# Altium schematic sheet Blokine diagrama.SchDoc
size A4; Date: *******; ApprovedBy: *******; CheckedBy: None; Author: *******; CompanyName: *******; DrawnBy: Name; Engineer: *******; Organization: *******; Address1: *******; Address2: *******; Address3: *******; Address4: *******; DocumentNumber: Doc Num; Revision: *******; SheetNumber: 1; SheetTotal: 8; CurrentTime: *******; CurrentDate: *******; Time: *******; DocumentFullPathAndName: *******; DocumentName: *******; ModifiedDate: *******; ImagePath: *******; ProjectName: *******; Application_BuildNumber: *******
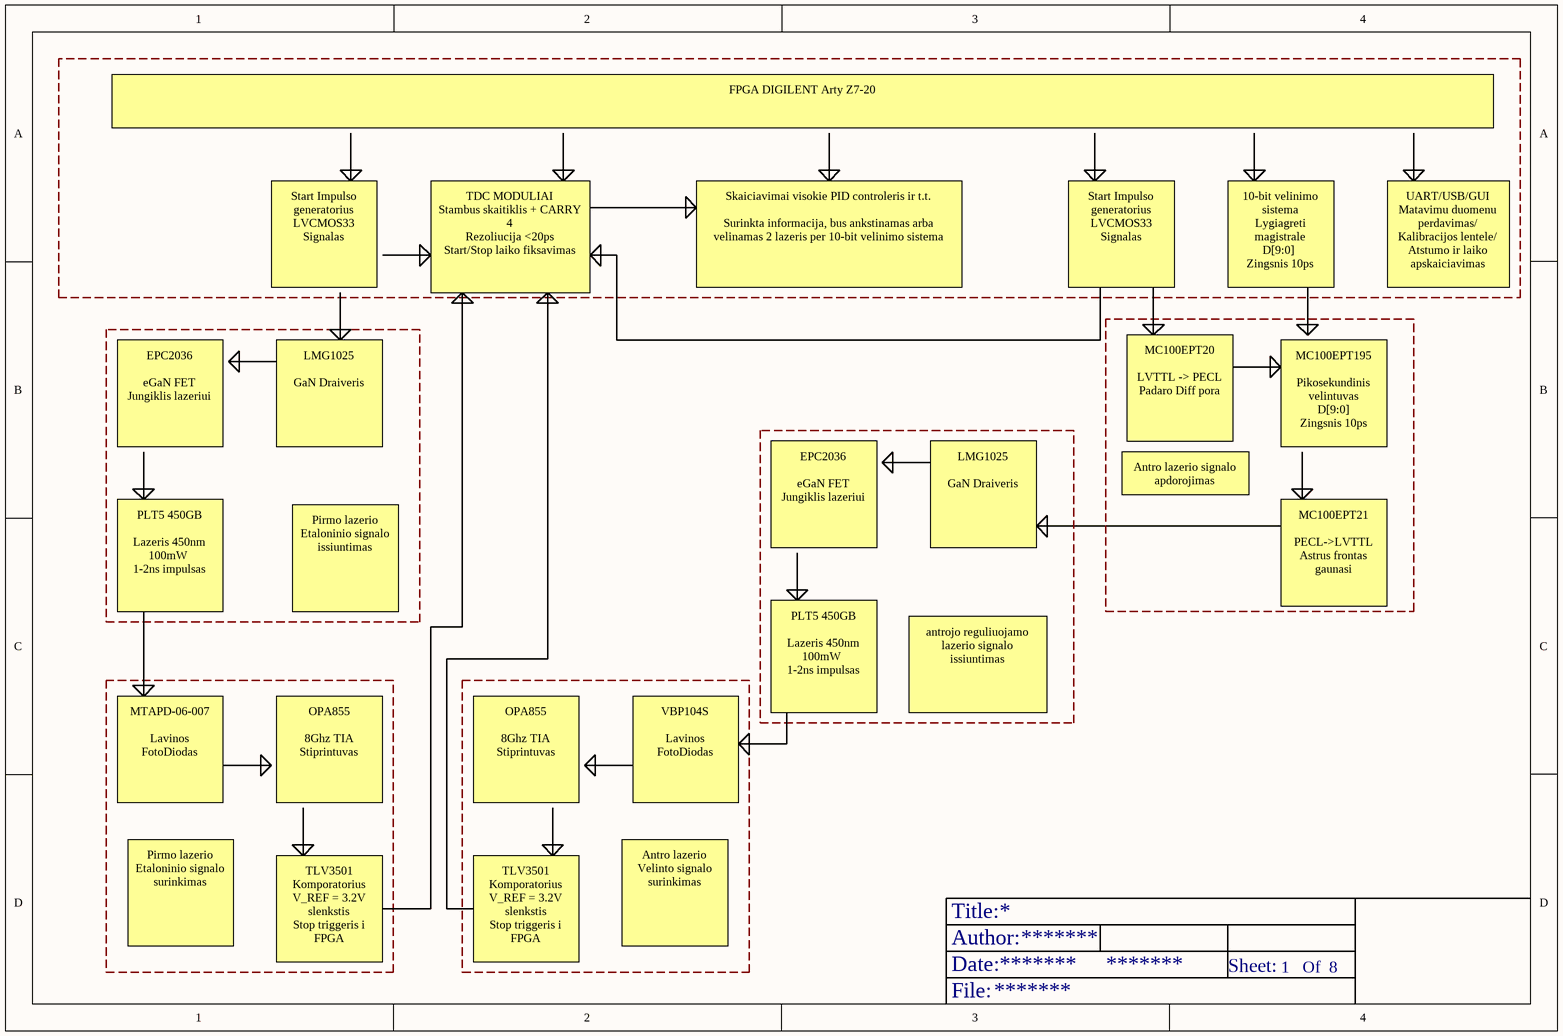
[diagram p0: Blokine diagrama.SchDoc]

## Notes on the sheet
- FPGA DIGILENT Arty Z7-20
- Start Impulso generatorius
  LVCMOS33 Signalas
- TDC MODULIAI
  Stambus skaitiklis + CARRY 4
  Rezoliucija <20ps
  Start/Stop laiko fiksavimas
- Skaiciavimai visokie PID controleris ir t.t.
  Surinkta informacija, bus ankstinamas arba velinamas 2 lazeris per 10-bit velinimo sistema
- 10-bit velinimo sistema
  Lygiagreti magistrale
  D[9:0]
  Zingsnis 10ps
- UART/USB/GUI
  Matavimu duomenu perdavimas/
  Kalibracijos lentele/
  Atstumo ir laiko apskaiciavimas
- EPC2036
  eGaN FET
  Jungiklis lazeriui
- LMG1025
  GaN Draiveris
- MC100EPT20
  LVTTL -> PECL
  Padaro Diff pora
- MC100EPT195
  Pikosekundinis velintuvas
  D[9:0]
  Zingsnis 10ps
- Antro lazerio signalo apdorojimas
- PLT5 450GB
  Lazeris 450nm
  100mW
  1-2ns impulsas
- Pirmo lazerio
  Etaloninio signalo issiuntimas
- MC100EPT21
  PECL->LVTTL
  Astrus frontas gaunasi
- antrojo reguliuojamo lazerio signalo issiuntimas
- MTAPD-06-007
  Lavinos FotoDiodas
- OPA855
  8Ghz TIA Stiprintuvas
- VBP104S
  Lavinos FotoDiodas
- Pirmo lazerio
  Etaloninio signalo surinkimas
- TLV3501
  Komporatorius
  V_REF = 3.2V slenkstis
  Stop triggeris i FPGA
- Antro lazerio
  Velinto signalo surinkimas
- Title:
- Date:
- Author:
- Sheet:
- Of
- File: